# Altium schematic sheet Sheet1.SchDoc
size A2; SheetNumber: 1; SheetTotal: 1
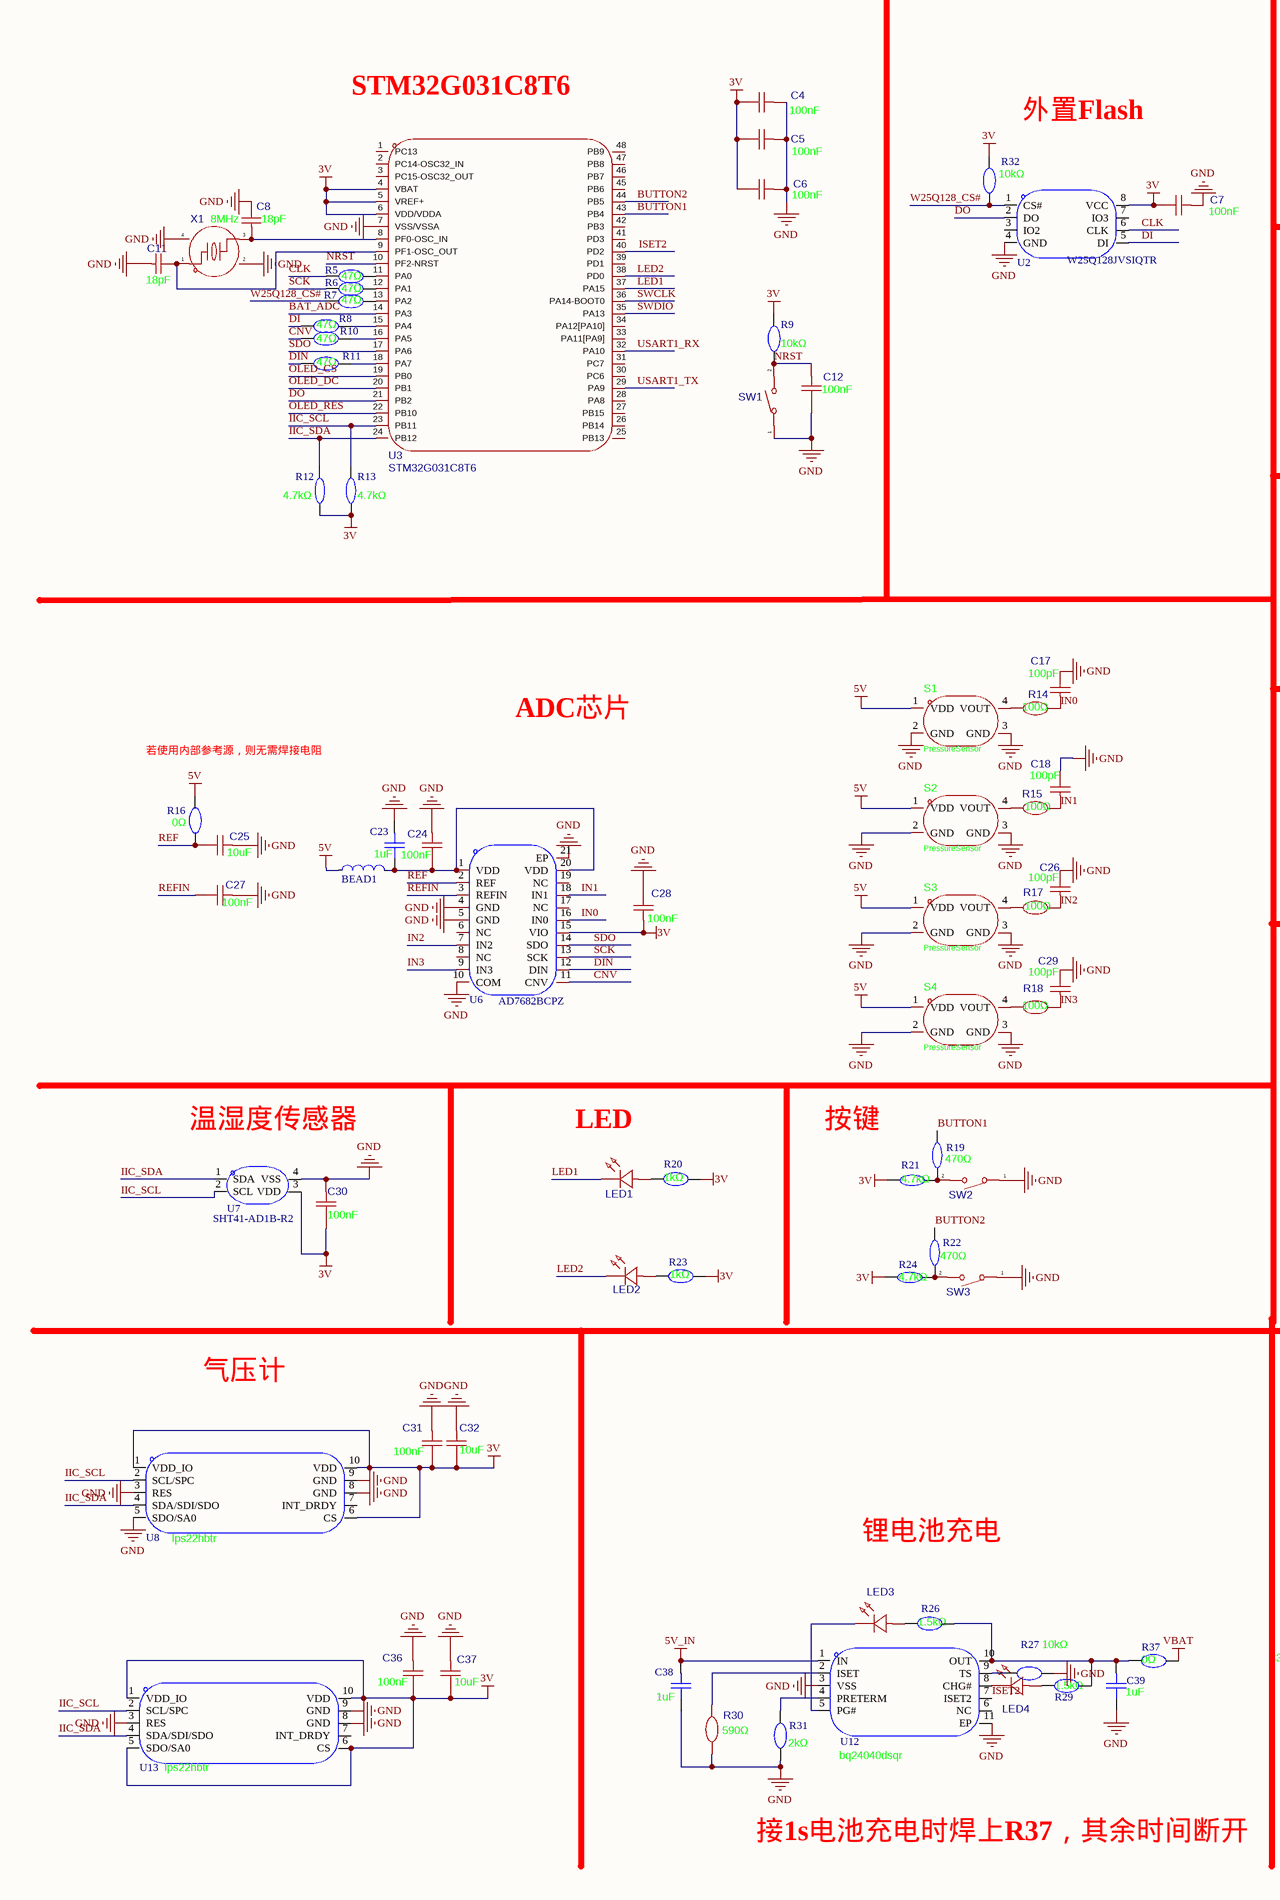
[diagram p0: Sheet1.SchDoc, left]
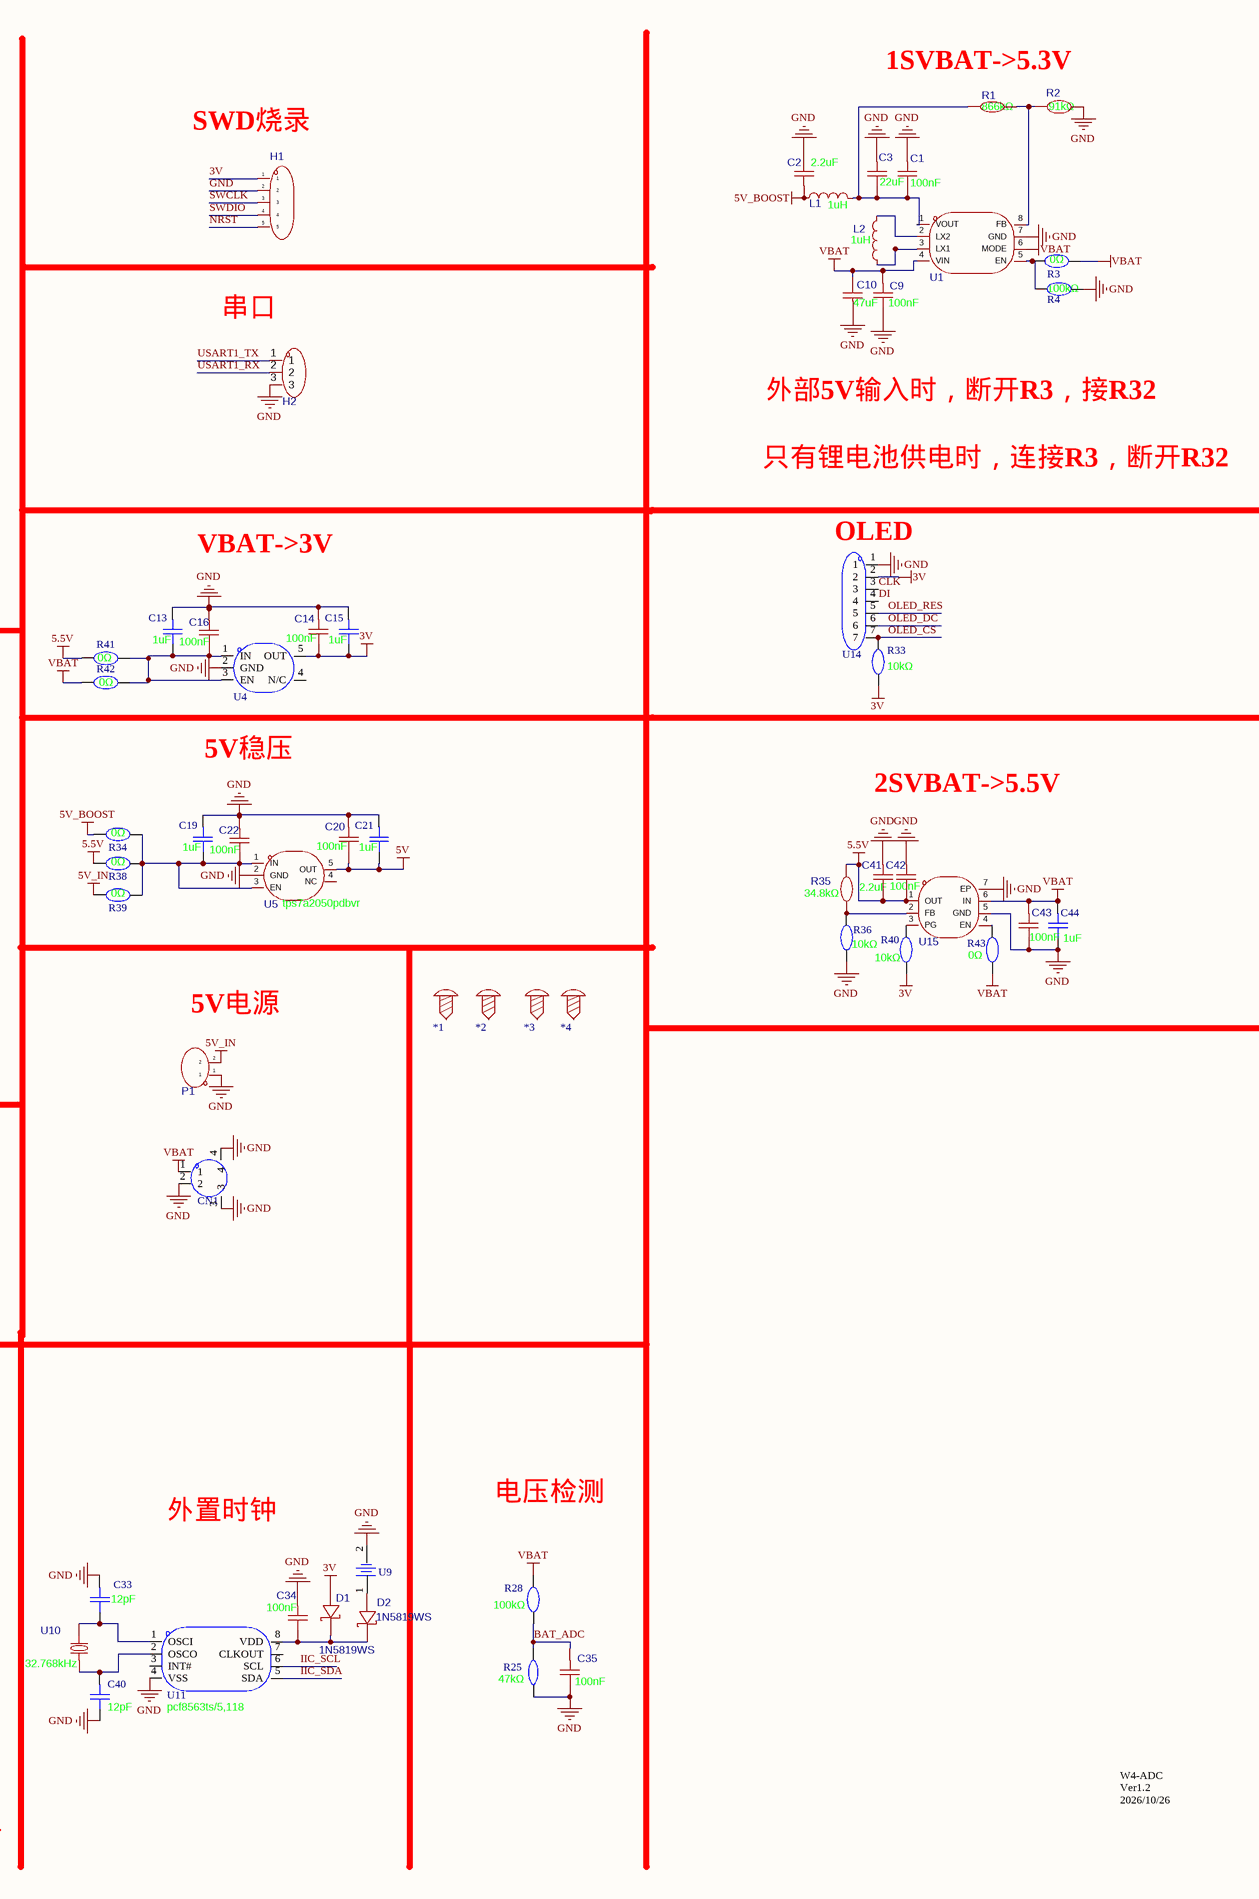
[diagram p1: Sheet1.SchDoc, right]

## Parts
*1  螺丝孔_1  [M3螺丝]  (value not drawn)
*2  螺丝孔_1  [M3螺丝]  (value not drawn)
*3  螺丝孔_1  [M3螺丝]  (value not drawn)
*4  螺丝孔_1  [M3螺丝]  (value not drawn)
BEAD1  cbm321609u000t  [L1206]  (value not drawn)
C1  value 100nF  [C0402]  (hidden comment: cc0402krx7r7bb104)
C2  value 2.2uF  [C0603]  (hidden comment: hgc0603r5225k500nthj)
C3  value 22uF  [C0805]  (hidden comment: cga0805x5r226m250mt)
C4  value 100nF  [C0402]  (hidden comment: cc0402krx7r7bb104)
C5  value 100nF  [C0402]  (hidden comment: cc0402krx7r7bb104)
C6  value 100nF  [C0402]  (hidden comment: cc0402krx7r7bb104)
C7  value 100nF  [C0402]  (hidden comment: cc0402krx7r7bb104)
C8  value 18pF  [C0402]  (hidden comment: cc0402jrnpo9bn180)
C9  value 100nF  [C0402]  (hidden comment: cc0402krx7r7bb104)
C10  value 47uF  [C0805]  (hidden comment: cl21a476mqynnne)
C11  value 18pF  [C0402]  (hidden comment: cc0402jrnpo9bn180)
C12  value 100nF  [C0402]  (hidden comment: cc0402krx7r7bb104)
C13  value 1uF  [C0402]  (hidden comment: cga0402x5r105k500gt)
C14  value 100nF  [C0402]  (hidden comment: cc0402krx7r7bb104)
C15  value 1uF  [C0402]  (hidden comment: cga0402x5r105k500gt)
C16  value 100nF  [C0402]  (hidden comment: cc0402krx7r7bb104)
C17  value 100pF  [C0402]  (hidden comment: cc0402jrnpo9bn101)
C18  value 100pF  [C0402]  (hidden comment: cc0402jrnpo9bn101)
C19  value 1uF  [C0402]  (hidden comment: cga0402x5r105k500gt)
C20  value 100nF  [C0402]  (hidden comment: cc0402krx7r7bb104)
C21  value 1uF  [C0402]  (hidden comment: cga0402x5r105k500gt)
C22  value 100nF  [C0402]  (hidden comment: cc0402krx7r7bb104)
C23  value 1uF  [C0402]  (hidden comment: cga0402x5r105k500gt)
C24  value 100nF  [C0402]  (hidden comment: cc0402krx7r7bb104)
C25  value 10uF  [C0603]  (hidden comment: hgc0603r5106m350nthj)
C26  value 100pF  [C0402]  (hidden comment: cc0402jrnpo9bn101)
C27  value 100nF  [C0402]  (hidden comment: cc0402krx7r7bb104)
C28  value 100nF  [C0402]  (hidden comment: cc0402krx7r7bb104)
C29  value 100pF  [C0402]  (hidden comment: cc0402jrnpo9bn101)
C30  value 100nF  [C0402]  (hidden comment: cc0402krx7r7bb104)
C31  value 100nF  [C0402]  (hidden comment: cc0402krx7r7bb104)
C32  value 10uF  [C0603]  (hidden comment: hgc0603r5106m350nthj)
C33  value 12pF  [C0402]  (hidden comment: cga0402c0g120j500gt)
C34  value 100nF  [C0402]  (hidden comment: cc0402krx7r7bb104)
C35  value 100nF  [C0402]  (hidden comment: cc0402krx7r7bb104)
C36  value 100nF  [C0402]  (hidden comment: cc0402krx7r7bb104)
C37  value 10uF  [C0603]  (hidden comment: hgc0603r5106m350nthj)
C38  value 1uF  [C0402]  (hidden comment: cga0402x5r105k500gt)
C39  value 1uF  [C0402]  (hidden comment: cga0402x5r105k500gt)
C40  value 12pF  [C0402]  (hidden comment: cga0402c0g120j500gt)
C41  value 2.2uF  [C0603]  (hidden comment: hgc0603r5225k500nthj)
C42  value 100nF  [C0402]  (hidden comment: cc0402krx7r7bb104)
C43  value 100nF  [C0402]  (hidden comment: cc0402krx7r7bb104)
C44  value 1uF  [C0402]  (hidden comment: cga0402x5r105k500gt)
CN1  2.54-2a-lt  [CONN-SMD_2P-P2.54_XH2.54-2AB]  (value not drawn)
D1  Symbol: 1N5819WS  [SOD-323_L1.8-W1.3-LS2.5-RD]  (hidden comment: 1n5819ws_c191023)
D2  Symbol: 1N5819WS  [SOD-323_L1.8-W1.3-LS2.5-RD]  (hidden comment: 1n5819ws_c191023)
H1  pz254v-11-05p  [HDR-TH_5P-P2.54-V-M]  (value not drawn)
H2  lail-pz2.54-3p-l  [HDR-TH_3P-P2.54-V-M-1]  (value not drawn)
L1  value 1uH  [IND-SMD_L2.0-W1.2_PCT201210]  (hidden comment: pct201210-1r0-m)
L2  value 1uH  [IND-SMD_L2.0-W1.2_PCT201210]  (hidden comment: pct201210-1r0-m)
LED1  xl-1005ugc_c965793  [LED0402-RD_GREEN]  (value not drawn)
LED2  xl-1005ugc_c965793  [LED0402-RD_GREEN]  (value not drawn)
LED3  xl-1005ugc_c965793  [LED0402-RD_GREEN]  (value not drawn)
LED4  xl-1005ugc_c965793  [LED0402-RD_GREEN]  (value not drawn)
P1  wj15edgrc-3.81-02p-14-00a  [CONN-TH_2P-P3.81_WJ15EDGRC-3.81-2P]  (value not drawn)
R1  value 866kΩ  [R0402]  (hidden comment: 0402wgf8663tce)
R2  value 91kΩ  [R0402]  (hidden comment: rt0402brd0791kl)
R3  value 0Ω  [R0402]  (hidden comment: frc0402f0000ts)
R4  value 100kΩ  [R0402]  (hidden comment: frc0402f1003ts)
R5  value 47Ω  [R0201]  (hidden comment: 0201wmf470jtee)
R6  value 47Ω  [R0201]  (hidden comment: 0201wmf470jtee)
R7  value 47Ω  [R0201]  (hidden comment: 0201wmf470jtee)
R8  value 47Ω  [R0201]  (hidden comment: 0201wmf470jtee)
R9  value 10kΩ  [R0402]  (hidden comment: frc0402f1002ts)
R10  value 47Ω  [R0201]  (hidden comment: 0201wmf470jtee)
R11  value 47Ω  [R0201]  (hidden comment: 0201wmf470jtee)
R12  value 4.7kΩ  [R0402]  (hidden comment: rc0402fr-074k7l)
R13  value 4.7kΩ  [R0402]  (hidden comment: rc0402fr-074k7l)
R14  value 100Ω  [R0402]  (hidden comment: frc0402f1000ts)
R15  value 100Ω  [R0402]  (hidden comment: frc0402f1000ts)
R16  value 0Ω  [R0402]  (hidden comment: frc0402f0000ts)
R17  value 100Ω  [R0402]  (hidden comment: frc0402f1000ts)
R18  value 100Ω  [R0402]  (hidden comment: frc0402f1000ts)
R19  value 470Ω  [R0402]  (hidden comment: 0402wgf4700tce)
R20  value 1kΩ  [R0402]  (hidden comment: frc0402j102 ts)
R21  value 4.7kΩ  [R0402]  (hidden comment: rc0402fr-074k7l)
R22  value 470Ω  [R0402]  (hidden comment: 0402wgf4700tce)
R23  value 1kΩ  [R0402]  (hidden comment: frc0402j102 ts)
R24  value 4.7kΩ  [R0402]  (hidden comment: rc0402fr-074k7l)
R25  value 47kΩ  [R0402]  (hidden comment: 0402wgf4702tce)
R26  value 1.5kΩ  [R0402]  (hidden comment: frc0402f1501ts)
R27  value 10kΩ  [R0402]  (hidden comment: frc0402f1002ts)
R28  value 100kΩ  [R0402]  (hidden comment: frc0402f1003ts)
R29  value 1.5kΩ  [R0402]  (hidden comment: frc0402f1501ts)
R30  value 590Ω  [R0402]  (hidden comment: frc0402f5900ts)
R31  value 2kΩ  [R0402]  (hidden comment: frc0402f2001ts)
R32  value 10kΩ  [R0402]  (hidden comment: frc0402f1002ts)
R33  value 10kΩ  [R0402]  (hidden comment: frc0402f1002ts)
R34  value 0Ω  [R0402]  (hidden comment: frc0402f0000ts)
R35  value 34.8kΩ  [R0402]  (hidden comment: frc0402f3482ts)
R36  value 10kΩ  [R0402]  (hidden comment: frc0402f1002ts)
R37  value 0Ω  [R0402]  (hidden comment: frc0402f0000ts)
R38  value 0Ω  [R0402]  (hidden comment: frc0402f0000ts)
R39  value 0Ω  [R0402]  (hidden comment: frc0402f0000ts)
R40  value 10kΩ  [R0402]  (hidden comment: frc0402f1002ts)
R41  value 0Ω  [R0402]  (hidden comment: frc0402f0000ts)
R42  value 0Ω  [R0402]  (hidden comment: frc0402f0000ts)
R43  value 0Ω  [R0402]  (hidden comment: frc0402f0000ts)
S1  PressureSensor  [PressureSensor]
S2  PressureSensor  [PressureSensor]
S3  PressureSensor  [PressureSensor]
S4  PressureSensor  [PressureSensor]
SW1  ts-1088-ar02016  [SW-SMD_L3.9-W3.0-P4.45]  (value not drawn)
SW2  ts-1088-ar02016  [SW-SMD_L3.9-W3.0-P4.45]  (value not drawn)
SW3  ts-1088-ar02016  [SW-SMD_L3.9-W3.0-P4.45]  (value not drawn)
U1  tps631000drlr  [SOT-583-8_L2.1-W1.2-P0.50-LS1.6-BL]  (value not drawn)
U2  Symbol: W25Q128JVSIQTR  [SOIC-8_L5.3-W5.3-P1.27-LS8.0-BL]  (hidden comment: w25q128jvsiq)
U3  stm32g031c8t6  [LQFP-48_L7.0-W7.0-P0.50-LS9.0-BL]
U4  lp5907mfx-3.0/nopb  [SOT-23-5_L3.0-W1.7-P0.95-LS2.8-BL]  (value not drawn)
U5  tps7a2050pdbvr  [SOT-23-5_L2.9-W1.6-P0.95-LS2.8-BR]
U6  ad7682bcpz  [LFCSP-20_L4.0-W4.0-P0.50-BL-EP]
U7  sht41-ad1b-r2  [DFN-4_L1.5-W1.5-SHT41-AD1B-R2]
U8  lps22hbtr  [HLGA-10L_LPS22HBTR]
U9  xdcr-1220-006  [BAT-SMD_CR1220-2ZX]  (value not drawn)
U10  value 32.768kHz  [CRYSTAL-SMD_L3.2-W1.5]  (hidden comment: fc31m2-32.768-ntlnndtl)
U11  pcf8563ts/5,118  [TSSOP-8_L3.0-W3.0-P0.65-LS4.9-BL]
U12  bq24040dsqr  [WSON-10_L2.0-W2.0-P0.40-BL-EP]
U13  lps22hbtr  [HLGA-10L_LPS22HBTR]
U14  kh-2.54fh-1x7p-h8.5  [HDR-TH_7P-P2.54-V-F]  (value not drawn)
U15  tps7a2501drvr  [WSON-6_L2.0-W2.0-P0.65-TL-EP]  (value not drawn)
X1  value 8MHz  [CRYSTAL-SMD_4P-L3.2-W2.5-BL]  (hidden comment: x32258mob4si)

## Nets
3V: C4.1 C5.1 C6.1 C7.1 C14.1 C15.1 C28.2 C30.1 C31.1 C32.1 C36.1 C37.1 D1.2(A) H1.1 R9.2 R12.1 R13.1 R20.2 R21.1 R23.2 R24.1 R32.2 R33.1 R40.1 U2.8(VCC) U3.4(VBAT) U3.5(VREF+) U3.6(VDD/VDDA) U4.5(OUT) U6.15(VIO) U7.3(VDD) U8.1(VDD_IO) U8.6(CS) U8.10(VDD) U13.1(VDD_IO) U13.5(SDO/SA0) U13.6(CS) U13.10(VDD) U14.2
5.5V: C41.1 C42.1 R35.2 R38.2 R41.1 U15.1(OUT)
5V: BEAD1.1 C20.1 C21.1 R16.2 S1.1(VDD) S2.1(VDD) S3.1(VDD) S4.1(VDD) U5.5(OUT)
5V_BOOST: C2.2 L1.1 R34.2
5V_IN: C38.2 P1.2 R39.2 U12.1(IN)
GND: C1.2 C2.1 C3.2 C4.2 C5.2 C6.2 C7.2 C8.2 C9.1 C10.1 C11.1 C12.1 C13.2 C14.2 C15.2 C16.2 C17.2 C18.2 C19.2 C20.2 C21.2 C22.2 C23.2 C24.2 C25.2 C26.2 C27.2 C28.1 C29.2 C30.2 C31.2 C32.2 C33.2 C34.2 C35.1 C36.2 C37.2 C38.1 C39.1 C40.1 C41.2 C42.2 C43.1 C44.1 CN1.2 CN1.3 CN1.4 H1.2 H2.3 P1.1 R2.2 R4.2 R25.1 R27.2 R30.1 R31.1 R36.1 S1.2(GND) S1.3(GND) S2.2(GND) S2.3(GND) S3.2(GND) S3.3(GND) S4.2(GND) S4.3(GND) SW1.1 SW2.1 SW3.1 U1.7(GND) U2.4(GND) U3.7(VSS/VSSA) U4.2(GND) U5.2(GND) U6.4(GND) U6.5(GND) U6.10(COM) U6.21(EP) U7.4(VSS) U8.3(RES) U8.5(SDO/SA0) U8.8(GND) U8.9(GND) U9.2 U11.4(VSS) U12.3(VSS) U12.11(EP) U13.3(RES) U13.8(GND) U13.9(GND) U14.1 U15.5(GND) U15.7(EP) X1.2(GND) X1.4(GND)
VBAT: C9.2 C10.2 C43.2 C44.2 CN1.1 R3.1 R28.2 R37.2 R42.1 R43.1 U1.4(VIN) U1.6(MODE) U15.6(IN)
BAT_ADC: C35.2 R25.2 R28.1 U3.14(PA3)
BUTTON1: R19.2 U3.43(PB4)
BUTTON2: R22.2 U3.44(PB5)
CLK: R5.1 U2.6(CLK) U14.3
CNV: R10.1 U6.11(CNV)
DI: R8.1 U2.5(DI) U14.4
DIN: R11.1 U6.12(DIN)
DO: U2.2(DO) U3.21(PB2)
IIC_SCL: R13.2 U3.23(PB11) U7.2(SCL) U8.2(SCL/SPC) U11.6(SCL) U13.2(SCL/SPC)
IIC_SDA: R12.2 U3.24(PB12) U7.1(SDA) U8.4(SDA/SDI/SDO) U11.5(SDA) U13.4(SDA/SDI/SDO)
IN0: C17.1 R14.2 U6.16(IN0)
IN1: C18.1 R15.2 U6.18(IN1)
IN2: C26.1 R17.2 U6.7(IN2)
IN3: C29.1 R18.2 U6.9(IN3)
ISET2: U3.40(PD2) U12.7(ISET2)
LED1: LED1.1(K) U3.37(PA15)
LED2: LED2.1(K) U3.38(PD0)
NRST: C12.2 H1.5 R9.1 SW1.2 U3.10(PF2-NRST)
OLED_CS: R33.2 U3.19(PB0) U14.7
OLED_DC: U3.20(PB1) U14.6
OLED_RES: U3.22(PB10) U14.5
REF: C25.1 R16.1 U6.2(REF)
REFIN: C27.1 U6.3(REFIN)
SCK: R6.1 U6.13(SCK)
SDO: U3.17(PA6) U6.14(SDO)
SWCLK: H1.3 U3.36(PA14-BOOT0)
SWDIO: H1.4 U3.35(PA13)
USART1_RX: H2.2 U3.32(PA10)
USART1_TX: H2.1 U3.29(PA9)
W25Q128_CS#: R7.1 R32.1 U2.1(CS#)
NetBEAD1_2: BEAD1.2 C23.1 C24.1 U6.1(VDD) U6.20(VDD)
NetC1_1: C1.1 C3.1 L1.2 R1.1 U1.1(VOUT)
NetC8_1: C8.1 U3.8(PF0-OSC_IN) X1.3
NetC11_2: C11.2 U3.9(PF1-OSC_OUT) X1.1
NetC13_1: C13.1 C16.1 R41.2 R42.2 U4.1(IN) U4.3(EN)
NetC19_1: C19.1 C22.1 R34.1 R38.1 R39.1 U5.1(IN) U5.3(EN)
NetC33_1: C33.1 U10.2 U11.1(OSCI)
NetC34_1: C34.1 D1.1(K) D2.1(K) U11.8(VDD)
NetC39_2: C39.2 R26.2 R29.2 R37.1 U12.10(OUT)
NetC40_2: C40.2 U10.1 U11.2(OSCO)
NetD2_2: D2.2(A) U9.1
NetL2_1: L2.1 U1.3(LX1)
NetL2_2: L2.2 U1.2(LX2)
NetLED1_2: LED1.2(A) R20.1
NetLED2_2: LED2.2(A) R23.1
NetLED3_1: LED3.1(K) U12.5(PG#)
NetLED3_2: LED3.2(A) R26.1
NetLED4_1: LED4.1(K) U12.8(CHG#)
NetLED4_2: LED4.2(A) R29.1
NetR1_2: R1.2 R2.1 U1.8(FB)
NetR3_2: R3.2 R4.1 U1.5(EN)
NetR5_2: R5.2 U3.11(PA0)
NetR6_2: R6.2 U3.12(PA1)
NetR7_2: R7.2 U3.13(PA2)
NetR8_2: R8.2 U3.15(PA4)
NetR10_2: R10.2 U3.16(PA5)
NetR11_2: R11.2 U3.18(PA7)
NetR14_1: R14.1 S1.4(VOUT)
NetR15_1: R15.1 S2.4(VOUT)
NetR17_1: R17.1 S3.4(VOUT)
NetR18_1: R18.1 S4.4(VOUT)
NetR19_1: R19.1 R21.2 SW2.2
NetR22_1: R22.1 R24.2 SW3.2
NetR27_1: R27.1 U12.9(TS)
NetR30_2: R30.2 U12.2(ISET)
NetR31_2: R31.2 U12.4(PRETERM)
NetR35_1: R35.1 R36.2 U15.2(FB)
NetR40_2: R40.2 U15.3(PG)
NetR43_2: R43.2 U15.4(EN)

Not connected (* = marked no-connect by the designer): *1 1; *2 1; *3 1; *4 1; U2 3(IO2) 7(IO3); U3 1(PC13) 2(PC14-OSC32_IN) 3(PC15-OSC32_OUT) 25(PB13) 26(PB14) 27(PB15) 28(PA8) 30(PC6) 31(PC7) 33(PA11[PA9]) 34(PA12[PA10]) 39(PD1) 41(PD3) 42(PB3) 45(PB6) 46(PB7) 47(PB8) 48(PB9); U4 4(N/C); U5 4(NC); U6 6(NC) 8(NC) 17(NC) 19(NC); U8 7(INT_DRDY); U11 3(INT#) 7(CLKOUT); U12 6(NC); U13 7(INT_DRDY)

## Notes on the sheet
- 1SVBAT->5.3V
- STM32G031C8T6
- 外置Flash
- (near H1) SWD烧录
- 串口
- 外部5V输入时，断开R3，接R32
- 只有锂电池供电时，连接R3，断开R32
- VBAT->3V
- (near U14) OLED
- ADC芯片
- 5V稳压
- 若使用内部参考源，则无需焊接电阻
- 2SVBAT->5.5V
- (near P1) 5V电源
- (near U7) 温湿度传感器
- LED
- 按键
- 气压计
- 锂电池充电
- 外置时钟
- 电压检测
- W4-ADC
  Ver1.2
  2026/10/26
- 接1s电池充电时焊上R37，其余时间断开

## Library data of the parts
BEAD1 = cbm321609u000t: 阻抗@频率:0Ω@100MHz;直流电阻(DCR):10mΩ;; Manufacturer: FH(风华); AddInBom: yes; ModelId: 85bdab7b3d4c4074b81d208eb5e865b3; ModelName: L1206_L3.2-W1.6-H1.1; ModelTransform: 125.984,62.835,0,0,0,0,0,0,0; DC Resistance(DCR): 10mΩ; Current Rating: 6A; Number of Circuits: 1; Symbol: CBM321609U000T; LCSC Part Name: 单路 1206磁珠 阻抗0Ω@100MHz; SupplierPart: C391206; ManufacturerPart: CBM321609U000T; Supplier Footprint: 1206; JLCPCB Part Class: Extended Part; Datasheet: https://item.szlcsc.com/datasheet/CBM321609U000T/367610.html; Supplier: LCSC; ConvertToPcb: yes; FootprintName: L1206; Impedance @ Frequency: 0Ω@100MHz; Operating Temperature: -55℃~+125℃
C1 C4-C7 C9 C12 C14 C16 C20 C22 C24 C27 C28 C30 C31 C34-C36 C42 C43 = cc0402krx7r7bb104: 容值:100nF;精度:±10%;额定电压:16V;温度系数:X7R;; Manufacturer: YAGEO(国巨); AddInBom: yes; ModelId: 36a51122f27c49738f86b3bfa98863e0; ModelName: C0402_L1.0-W0.5-H0.5; ModelTransform: 39.37,19.685,0,0,0,0,0,0,0; Tolerance: ±10%; Voltage Rating: 16V; Temperature Coefficient: X7R; Symbol: CC0402KRX7R7BB104; LCSC Part Name: 100nF ±10% 16V; SupplierPart: C60474; ManufacturerPart: CC0402KRX7R7BB104; Supplier Footprint: 0402; JLCPCB Part Class: Extended Part; Datasheet: https://item.szlcsc.com/datasheet/CC0402KRX7R7BB104/61526.html; Supplier: LCSC; ConvertToPcb: yes; FootprintName: C0402
C2 C41 = hgc0603r5225k500nthj: 容值:2.2uF;精度:±10%;额定电压:50V;温度系数:X5R;; Manufacturer: Chinocera(华瓷); AddInBom: yes; ModelId: ac125912035d415993ca9572d50418b1; ModelName: C0603_L1.6-W0.8-H0.8; ModelTransform: 62.992,31.496,0,0,0,0,0,0,0; Tolerance: ±10%; Voltage Rating: 50V; Temperature Coefficient: X5R; Symbol: HGC0603R5225K500NTHJ; LCSC Part Name: 2.2uF ±10% 50V; SupplierPart: C7432769; ManufacturerPart: HGC0603R5225K500NTHJ; Supplier Footprint: 0603; JLCPCB Part Class: Extended Part; Datasheet: https://item.szlcsc.com/datasheet/HGC0603R5225K500NTHJ/8438251.html; Supplier: LCSC; ConvertToPcb: yes; FootprintName: C0603
C3 = cga0805x5r226m250mt: 容值:22uF;精度:±20%;额定电压:25V;温度系数:X5R;; Manufacturer: HRE(芯声); AddInBom: yes; ModelId: 1ba041120af144c991958decab20d241; ModelName: C0805_L2.0-W1.3-H1.3; ModelTransform: 78.74,51.181,0,0,0,0,0,0.0005,0; Tolerance: ±20%; Voltage Rating: 25V; Temperature Coefficient: X5R; Symbol: CGA0805X5R226M250MT; LCSC Part Name: 22uF ±20% 25V; SupplierPart: C6119899; ManufacturerPart: CGA0805X5R226M250MT; Supplier Footprint: 0805; JLCPCB Part Class: Extended Part; Datasheet: https://item.szlcsc.com/datasheet/CGA0805X5R226M250MT/7062605.html; Supplier: LCSC; ConvertToPcb: yes; FootprintName: C0805
C8 C11 = cc0402jrnpo9bn180: 容值:18pF;精度:±5%;额定电压:50V;温度系数:NP0;; Manufacturer: YAGEO(国巨); AddInBom: yes; ModelId: 36a51122f27c49738f86b3bfa98863e0; ModelName: C0402_L1.0-W0.5-H0.5; ModelTransform: 39.37,19.685,0,0,0,0,0,0,0; Tolerance: ±5%; Voltage Rating: 50V; Temperature Coefficient: NP0; Symbol: CC0402JRNPO9BN180; LCSC Part Name: 18pF ±5% 50V; SupplierPart: C106202; ManufacturerPart: CC0402JRNPO9BN180; Supplier Footprint: 0402; JLCPCB Part Class: Extended Part; Datasheet: https://item.szlcsc.com/datasheet/CC0402JRNPO9BN180/107417.html; Supplier: LCSC; ConvertToPcb: yes; FootprintName: C0402
C10 = cl21a476mqynnne: 容值:47uF;精度:±20%;额定电压:6.3V;温度系数:X5R;; Manufacturer: SAMSUNG(三星); AddInBom: yes; ModelId: 1ba041120af144c991958decab20d241; ModelName: C0805_L2.0-W1.3-H1.3; ModelTransform: 78.74,51.181,0,0,0,0,0,0.0005,0; Tolerance: ±20%; Voltage Rating: 6.3V; Temperature Coefficient: X5R; Symbol: CL21A476MQYNNNE; LCSC Part Name: 47uF ±20% 6.3V; SupplierPart: C16780; ManufacturerPart: CL21A476MQYNNNE; Supplier Footprint: 0805; JLCPCB Part Class: Basic Part; Datasheet: https://item.szlcsc.com/datasheet/CL21A476MQYNNNE/17464.html; Supplier: LCSC; ConvertToPcb: yes; FootprintName: C0805
C13 C15 C19 C21 C23 C38 C39 C44 = cga0402x5r105k500gt: 容值:1uF;精度:±10%;额定电压:50V;温度系数:X5R;; Manufacturer: HRE(芯声); AddInBom: yes; ModelId: 36a51122f27c49738f86b3bfa98863e0; ModelName: C0402_L1.0-W0.5-H0.5; ModelTransform: 39.37,19.685,0,0,0,0,0,0,0; Tolerance: ±10%; Voltage Rating: 50V; Temperature Coefficient: X5R; Symbol: CGA0402X5R105K500GT; LCSC Part Name: 1uF ±10% 50V; SupplierPart: C6119811; ManufacturerPart: CGA0402X5R105K500GT; Supplier Footprint: 0402; JLCPCB Part Class: Extended Part; Datasheet: https://item.szlcsc.com/datasheet/CGA0402X5R105K500GT/7062517.html; Supplier: LCSC; ConvertToPcb: yes; FootprintName: C0402
C17 C18 C26 C29 = cc0402jrnpo9bn101: 容值:100pF;精度:±5%;额定电压:50V;温度系数:NP0;; Manufacturer: YAGEO(国巨); AddInBom: yes; ModelId: 36a51122f27c49738f86b3bfa98863e0; ModelName: C0402_L1.0-W0.5-H0.5; ModelTransform: 39.37,19.685,0,0,0,0,0,0,0; Tolerance: ±5%; Voltage Rating: 50V; Temperature Coefficient: NP0; Symbol: CC0402JRNPO9BN101; LCSC Part Name: 100pF ±5% 50V; SupplierPart: C106200; ManufacturerPart: CC0402JRNPO9BN101; Supplier Footprint: 0402; JLCPCB Part Class: Extended Part; Datasheet: https://item.szlcsc.com/datasheet/CC0402JRNPO9BN101/107415.html; Supplier: LCSC; ConvertToPcb: yes; FootprintName: C0402
C25 C32 C37 = hgc0603r5106m350nthj: 容值:10uF;精度:±20%;额定电压:35V;温度系数:X5R;; Manufacturer: Chinocera(华瓷); AddInBom: yes; ModelId: ac125912035d415993ca9572d50418b1; ModelName: C0603_L1.6-W0.8-H0.8; ModelTransform: 62.992,31.496,0,0,0,0,0,0,0; Tolerance: ±20%; Voltage Rating: 35V; Temperature Coefficient: X5R; Symbol: HGC0603R5106M350NTHJ; LCSC Part Name: 10uF ±20% 35V; SupplierPart: C22367827; ManufacturerPart: HGC0603R5106M350NTHJ; Supplier Footprint: 0603; JLCPCB Part Class: Extended Part; Datasheet: https://item.szlcsc.com/datasheet/HGC0603R5106M350NTHJ/23841132.html; Supplier: LCSC; ConvertToPcb: yes; FootprintName: C0603
C33 C40 = cga0402c0g120j500gt: 容值:12pF;精度:±5%;额定电压:50V;温度系数:C0G;; Manufacturer: HRE(芯声); AddInBom: yes; ModelId: 36a51122f27c49738f86b3bfa98863e0; ModelName: C0402_L1.0-W0.5-H0.5; ModelTransform: 39.37,19.685,0,0,0,0,0,0,0; Tolerance: ±5%; Voltage Rating: 50V; Temperature Coefficient: C0G; Symbol: CGA0402C0G120J500GT; LCSC Part Name: 12pF ±5% 50V 停产; SupplierPart: C45359894; ManufacturerPart: CGA0402C0G120J500GT; Supplier Footprint: 0402; JLCPCB Part Class: Extended Part; Datasheet: https://item.szlcsc.com/datasheet/CGA0402C0G120J500GT/47452244.html; Supplier: LCSC; ConvertToPcb: yes; FootprintName: C0402
CN1 = 2.54-2a-lt: 插针结构:1x2P;间距:2.54mm;安装方式:立贴;参考系列:XH;总PIN数:2P;排数:1;每排PIN数:2;行距:-;额定电流:500mA;触头材质:磷铜;触头镀层:锡;工作温度:-25℃~+85℃;; Manufacturer: CAX(创都); AddInBom: yes; ModelId: d8a33bf5c0154e0995c08ba39c3c8f35; ModelName: CONN-SMD_XH2.54-LS-2P; ModelTransform: 393.7,354.33,0,0,0,0,0,9.843,0; Pins Structure: 1x2P; Pitch: 2.54mm; Reference Series: XH; Number of PINs Per Row: 2; Current Rating: 500mA; Voltage Rating: 50V; Plastic Material: LCP; Z-Height of the Board: 7.9mm; Y-Width of Bottom Edge on Board: 6mm; Symbol: 2.54-2A-LT; LCSC Part Name: 1x2P 间距:2.54mm 立贴 系列:XH; SupplierPart: C722695; ManufacturerPart: 2.54-2A-LT; Supplier Footprint: SMD,P=2.54mm; JLCPCB Part Class: Extended Part; Datasheet: https://item.szlcsc.com/datasheet/2.54-2A-LT/766902.html; Supplier: LCSC; ConvertToPcb: yes; FootprintName: CONN-SMD_2P-P2.54_XH2.54-2AB; Mounting Type: 立贴; Number of Pins: 2P; Number of Rows: 1; Row Spacing: -; Contact Material: 磷铜; Contact Plating: 锡; Operating Temperature: -25℃~+85℃; Color: 米色
D1 D2 = 1n5819ws_c191023: 正向压降(Vf):600mV@1A;直流反向耐压(Vr):40V;整流电流:1A;; Manufacturer: Hottech(合科泰); AddInBom: yes; ModelId: db63db13d9e342eb939127d413d6200b; ModelTransform: 104.3305,51.181,0,0,0,0,0,-0.004,0; Voltage - DC Reverse(Vr): 40V; Current - Rectified: 1A; Non-Repetitive Peak Forward Surge Current: 25A; LCSC Part Name: 电压:40V 电流:1A; SupplierPart: C191023; ManufacturerPart: 1N5819WS; Supplier Footprint: SOD-323; JLCPCB Part Class: Basic Part; Datasheet: https://item.szlcsc.com/datasheet/1N5819WS/213850.html; Supplier: LCSC; ConvertToPcb: yes; FootprintName: SOD-323_L1.8-W1.3-LS2.5-RD; ModelName: SOD-323_L1.8-W1.3-LS2.5-RD; Voltage - Forward(Vf@If): 600mV@1A
H1 = pz254v-11-05p: 插针结构:1x5P;间距:2.54mm;行距:-;圆针/方针:方针;安装方式:直插;排数:单排;总PIN位数:5P;额定电流:3A;额定电压:250V;配合针长度:6mm;塑高:2.5mm;端接针长度:3mm;触头材质:黄铜;触头镀层:-;工作温度:-40℃~+105℃;颜色:黑色;; Manufacturer: XFCN(兴飞); AddInBom: yes; ModelId: 47d466e4a34f4fc5bc626cf773a24dd5; ModelName: HDR-TH_5P-P2.54-M-LI-1X5P; ModelTransform: 499.999,100,0,0,0,0,0,0,-118.11; Pin Structure: 1x5P; Pitch: 2.54mm; Circluar Pins/Square Pins: 方针; Current Rating: 3A; Voltage Rating (Max): 250V; Symbol: PZ254V-11-05P; LCSC Part Name: 1x5P 间距:2.54mm 方针 直插; SupplierPart: C492404; ManufacturerPart: PZ254V-11-05P; Supplier Footprint: 插件,P=2.54mm; JLCPCB Part Class: Extended Part; Datasheet: https://item.szlcsc.com/datasheet/PZ254V-11-05P/502960.html; Supplier: LCSC; ConvertToPcb: yes; FootprintName: HDR-TH_5P-P2.54-V-M; Row Spacing: -; Mounting Type: 直插; Number of Rows: 单排; Number of Pins: 5P; Length of Mating Pin: 6mm; Insulation Height: 2.5mm; Length of End Connection Pin: 3mm; Contact Material: 黄铜; Contact Plating: -; Operating Temperature: -40℃~+105℃; Color: 黑色
H2 = lail-pz2.54-3p-l: 插针结构:1x3P;间距:2.54mm;圆针/方针:方针;排数:单排;总PIN位数:3P;额定电流:3A;额定电压:250V;塑高:2.5mm;端接针长度:3mm;触头材质:黄铜;触头镀层:金;工作温度:-25℃~+80℃;颜色:黑色;; Manufacturer: LAILAN(莱联); AddInBom: yes; ModelId: 94a8ffe137b6410295cb18cd3ffd99db; ModelName: HDR-M-2.54_1x3; ModelTransform: 299.9994,100,0,0,0,0,0,0,-118.11; Pin Structure: 1x3P; Pitch: 2.54mm; Circluar Pins/Square Pins: 方针; Current Rating: 3A; Voltage Rating (Max): 250V; LCSC Part Name: 1x3P 间距:2.54mm 方针; SupplierPart: C54950604; ManufacturerPart: LAIL-PZ2.54-3P-L; Supplier Footprint: 插件,P=2.54mm; JLCPCB Part Class: Extended Part; Datasheet: https://item.szlcsc.com/datasheet/LAIL-PZ2.54-3P-L/58519957.html; Supplier: LCSC; ConvertToPcb: yes; SymbolName: LAIL-PZ2.54-3P-L; FootprintName: HDR-TH_3P-P2.54-V-M-1; Number of Rows: 单排; Number of Pins: 3P; Insulation Height: 2.5mm; Length of End Connection Pin: 3mm; Contact Material: 黄铜; Contact Plating: 金; Operating Temperature: -25℃~+80℃; Color: 黑色
L1 L2 = pct201210-1r0-m: 小型化一体成型T-CORE，小体积，扁线工艺，感值小; Manufacturer: JIERR(捷而瑞); AddInBom: yes; Tolerance: ±20%; Current Rating: 3A; Current - Saturation(Isat): 3.3A; DC Resistance(DCR): 80mΩ; Type: 一体成型电感; Symbol: PCT201210-1R0-M; LCSC Part Name: 1μH ±20% 3.3A; SupplierPart: C54557069; ManufacturerPart: PCT201210-1R0-M; Supplier Footprint: 0805; JLCPCB Part Class: Extended Part; Datasheet: https://item.szlcsc.com/datasheet/PCT201210-1R0-M/57921657.html; Supplier: LCSC; ConvertToPcb: yes; FootprintName: IND-SMD_L2.0-W1.2_PCT201210
LED1-LED4 = xl-1005ugc_c965793: 灯头类型:1.0mmx0.5mm方形灯头;发光颜色:翠绿色;正向压降(Vf):3V;功率:80mW;正向电流:25mA;波长:516nm~531nm;二极管配置:独立二极管;透镜颜色:无色透明透镜;色温:-;发光强度:249mcd;发光角度:120°;载带方式:正贴;工作温度:-40℃~+85℃;; Manufacturer: XINGLIGHT(成兴光); AddInBom: yes; ModelId: 080bb9bd520f4b34ac21e218e7b036d6; ModelName: LED0402_L1.0-W0.5-H0.2; ModelTransform: 40.1574,19.685,0,0,0,0,0,-0.0005,0; Illumination Color: 翠绿色; Voltage - Forward(Vf): 3V; Power(Watts): 80mW; Forward Current: 25mA; Peak Wavelength: 531nm; Diode Configuration: 独立二极管; Lens Color: 无色透明透镜; Luminous Intensity: 249mcd; Viewing Angle: 120°; Symbol: XL-1005UGC; LCSC Part Name: 0402翠绿贴片式发光二极管; SupplierPart: C965793; ManufacturerPart: XL-1005UGC; Supplier Footprint: 0402; JLCPCB Part Class: Extended Part; Datasheet: https://item.szlcsc.com/datasheet/XL-1005UGC/1051402.html; Supplier: LCSC; ConvertToPcb: yes; FootprintName: LED0402-RD_GREEN; Lamp Holder Type: 1.0mmx0.5mm方形灯头; Wavelength - Dominant: 516nm~531nm; Color Temperature: -; Mounting Style: 正贴; Operating Temperature: -40℃~+85℃
P1 = wj15edgrc-3.81-02p-14-00a: 连接器类型:板端/插座-闭口;固定方式:无固定装置;结构:1x2P;间距:3.81mm;颜色:绿色;安装方式:弯插;排数:1;每排PIN数:2;额定电流:8A;额定电压:300V;线规 - AWG:-;线规 - 平方毫米:-;工作温度:-40℃~+105℃;; Manufacturer: KANGNEX(康奈克斯电气); Symbol: WJ15EDGRC-3.81-2P; AddInBom: yes; ModelId: 816ec8aca6fe4785be70cb4c5121258d; ModelName: CONN-TH_2P_L8.5-W9.2-H7.0-P3.81; ModelTransform: 334.645,360.2355,0,0,0,0,0,-118.11,-137.795; Number of Positions or Pins: 1x2P; Pitch: 3.81mm; Number of PINs Per Row: 2; Current Rating: 8A; Voltage Rating (Max): 300V; LCSC Part Name: 无固定装置 1x2P 3.81mm 排数:1 每排P数:2; SupplierPart: C8387; ManufacturerPart: WJ15EDGRC-3.81-02P-14-00A; Supplier Footprint: 弯插,P=3.81mm; JLCPCB Part Class: Extended Part; Datasheet: https://item.szlcsc.com/datasheet/WJ15EDGRC-3.81-02P-14-00A/8881.html; Supplier: LCSC; ConvertToPcb: yes; FootprintName: CONN-TH_2P-P3.81_WJ15EDGRC-3.81-2P; Connector Type: 板端/插座-闭口; Termination Style: 无固定装置; Color: 绿色; Mounting Type: 弯插; Number of Pins: 2P; Number of Rows: 1; Wire Gauge - AWG: -; Wire Gauge - mm2: -; Operating Temperature: -40℃~+105℃; Connection Type: -; Outlet Direction (Vertical Basis): -
R1 = 0402wgf8663tce: 电阻类型:厚膜电阻;阻值:866kΩ;精度:±1%;功率:62.5mW;工作电压:50V;温度系数:±100ppm/℃;; Manufacturer: UNI-ROYAL(厚声); AddInBom: yes; ModelId: 98c88bc2b9094f218f3a3e30a7012738; ModelName: R0402_L1.0-W0.5-H0.4; ModelTransform: 39.37,19.685,0,0,0,0,0,0,0; Tolerance: ±1%; Power(Watts): 62.5mW; Voltage-Supply(Max): 50V; Symbol: 0402WGF8663TCE; LCSC Part Name: 厚膜电阻 866kΩ ±1%; SupplierPart: C27020; ManufacturerPart: 0402WGF8663TCE; Supplier Footprint: 0402; JLCPCB Part Class: Extended Part; Datasheet: https://item.szlcsc.com/datasheet/0402WGF8663TCE/27769.html; Supplier: LCSC; ConvertToPcb: yes; FootprintName: R0402; Type: 厚膜电阻; Temperature Coefficient: ±100ppm/℃; Operating Temperature: -55℃~+155℃
R2 = rt0402brd0791kl: 电阻类型:薄膜电阻;阻值:91kΩ;精度:±0.1%;功率:62.5mW;工作电压:50V;温度系数:±25ppm/℃;; Manufacturer: YAGEO(国巨); AddInBom: yes; ModelId: 98c88bc2b9094f218f3a3e30a7012738; ModelName: R0402_L1.0-W0.5-H0.4; ModelTransform: 39.37,19.685,0,0,0,0,0,0,0; Tolerance: ±0.1%; Power(Watts): 62.5mW; Voltage-Supply(Max): 50V; Symbol: RT0402BRD0791KL; LCSC Part Name: 薄膜电阻 91kΩ ±0.1% 62.5mW; SupplierPart: C852952; ManufacturerPart: RT0402BRD0791KL; Supplier Footprint: 0402; JLCPCB Part Class: Extended Part; Datasheet: https://item.szlcsc.com/datasheet/RT0402BRD0791KL/913274.html; Supplier: LCSC; ConvertToPcb: yes; FootprintName: R0402; Type: 薄膜电阻; Temperature Coefficient: ±25ppm/℃; Operating Temperature: -55℃~+155℃
R3 R16 R34 R37-R39 R41-R43 = frc0402f0000ts: 电阻类型:厚膜电阻;阻值:0Ω;精度:±1%;功率:62.5mW;工作电压:50V;温度系数:±400ppm/℃;; Manufacturer: FOJAN(富捷); AddInBom: yes; ModelId: 98c88bc2b9094f218f3a3e30a7012738; ModelName: R0402_L1.0-W0.5-H0.4; ModelTransform: 39.37,19.685,0,0,0,0,0,0,0; Tolerance: ±1%; Power(Watts): 62.5mW; Voltage-Supply(Max): 50V; Symbol: FRC0402F0000TS; LCSC Part Name: 0Ω ±1% 62.5mW 厚膜电阻; SupplierPart: C2906858; ManufacturerPart: FRC0402F0000TS; Supplier Footprint: 0402; JLCPCB Part Class: Extended Part; Datasheet: https://item.szlcsc.com/datasheet/FRC0402F0000TS/3180371.html; Supplier: LCSC; ConvertToPcb: yes; FootprintName: R0402; Type: 厚膜电阻; Temperature Coefficient: ±400ppm/℃; Operating Temperature: -55℃~+155℃
R4 R28 = frc0402f1003ts: 电阻类型:厚膜电阻;阻值:100kΩ;精度:±1%;功率:62.5mW;工作电压:50V;温度系数:±100ppm/℃;; Manufacturer: FOJAN(富捷); AddInBom: yes; ModelId: 98c88bc2b9094f218f3a3e30a7012738; ModelName: R0402_L1.0-W0.5-H0.4; ModelTransform: 39.37,19.685,0,0,0,0,0,0,0; Tolerance: ±1%; Power(Watts): 62.5mW; Voltage-Supply(Max): 50V; Symbol: FRC0402F1003TS; LCSC Part Name: 100kΩ ±1% 62.5mW 厚膜电阻; SupplierPart: C2906859; ManufacturerPart: FRC0402F1003TS; Supplier Footprint: 0402; JLCPCB Part Class: Extended Part; Datasheet: https://item.szlcsc.com/datasheet/FRC0402F1003TS/3180372.html; Supplier: LCSC; ConvertToPcb: yes; FootprintName: R0402; Type: 厚膜电阻; Temperature Coefficient: ±100ppm/℃; Operating Temperature: -55℃~+155℃
R5-R8 R10 R11 = 0201wmf470jtee: 电阻类型:厚膜电阻;阻值:47Ω;精度:±1%;功率:50mW;最大工作电压:25V;温度系数:±200ppm/℃;; Manufacturer: UNI-ROYAL(厚声); AddInBom: yes; ModelId: 0e006ba4c37b4b73b0e85d5d1c6800cb; ModelName: R0201_L0.6-W0.3-H0.3; ModelTransform: 23.622,11.811,0,0,0,0,0,-0.0005,0; Tolerance: ±1%; Power(Watts): 50mW; Overload Voltage (Max): 25V; Symbol: 0201WMF470JTEE; LCSC Part Name: 47Ω ±1% 50mW 厚膜电阻; SupplierPart: C620443; ManufacturerPart: 0201WMF470JTEE; Supplier Footprint: 0201; JLCPCB Part Class: Extended Part; Datasheet: https://atta.szlcsc.com/upload/public/pdf/source/20200306/C422600_1E6D84923E4A46A82E41ADD87F860B5C.pdf; Supplier: LCSC; ConvertToPcb: yes; FootprintName: R0201; Type: 厚膜电阻; Temperature Coefficient: ±200ppm/℃; Operating Temperature Range: -55℃~+155℃
R9 R27 R32 R33 R36 R40 = frc0402f1002ts: 电阻类型:厚膜电阻;阻值:10kΩ;精度:±1%;功率:62.5mW;工作电压:50V;温度系数:±100ppm/℃;; Manufacturer: FOJAN(富捷); AddInBom: yes; ModelId: 98c88bc2b9094f218f3a3e30a7012738; ModelName: R0402_L1.0-W0.5-H0.4; ModelTransform: 39.37,19.685,0,0,0,0,0,0,0; Tolerance: ±1%; Power(Watts): 62.5mW; Voltage-Supply(Max): 50V; Symbol: FRC0402F1002TS; LCSC Part Name: 10kΩ ±1% 62.5mW 厚膜电阻; SupplierPart: C2906861; ManufacturerPart: FRC0402F1002TS; Supplier Footprint: 0402; JLCPCB Part Class: Extended Part; Datasheet: https://item.szlcsc.com/datasheet/FRC0402F1002TS/3180374.html; Supplier: LCSC; ConvertToPcb: yes; FootprintName: R0402; Type: 厚膜电阻; Temperature Coefficient: ±100ppm/℃; Operating Temperature: -55℃~+155℃
R12 R13 R21 R24 = rc0402fr-074k7l: 电阻类型:厚膜电阻;阻值:4.7kΩ;精度:±1%;功率:62.5mW;工作电压:50V;温度系数:±100ppm/℃;; Manufacturer: YAGEO(国巨); AddInBom: yes; ModelId: 98c88bc2b9094f218f3a3e30a7012738; ModelName: R0402_L1.0-W0.5-H0.4; ModelTransform: 39.37,19.685,0,0,0,0,0,0,0; Tolerance: ±1%; Power(Watts): 62.5mW; Voltage-Supply(Max): 50V; Symbol: RC0402FR-074K7L; LCSC Part Name: 厚膜电阻 4.7kΩ ±1% 62.5mW; SupplierPart: C105871; ManufacturerPart: RC0402FR-074K7L; Supplier Footprint: 0402; JLCPCB Part Class: Extended Part; Datasheet: https://item.szlcsc.com/datasheet/RC0402FR-074K7L/107086.html; Supplier: LCSC; ConvertToPcb: yes; FootprintName: R0402; Type: 厚膜电阻; Temperature Coefficient: ±100ppm/℃; Operating Temperature: -55℃~+155℃
R14 R15 R17 R18 = frc0402f1000ts: 电阻类型:厚膜电阻;阻值:100Ω;精度:±1%;功率:62.5mW;工作电压:50V;温度系数:±100ppm/℃;; Manufacturer: FOJAN(富捷); AddInBom: yes; ModelId: 98c88bc2b9094f218f3a3e30a7012738; ModelName: R0402_L1.0-W0.5-H0.4; ModelTransform: 39.37,19.685,0,0,0,0,0,0,0; Tolerance: ±1%; Power(Watts): 62.5mW; Voltage-Supply(Max): 50V; Symbol: FRC0402F1000TS; LCSC Part Name: 100Ω ±1% 62.5mW 厚膜电阻; SupplierPart: C2906860; ManufacturerPart: FRC0402F1000TS; Supplier Footprint: 0402; JLCPCB Part Class: Extended Part; Datasheet: https://item.szlcsc.com/datasheet/FRC0402F1000TS/3180373.html; Supplier: LCSC; ConvertToPcb: yes; FootprintName: R0402; Type: 厚膜电阻; Temperature Coefficient: ±100ppm/℃; Operating Temperature: -55℃~+155℃
R19 R22 = 0402wgf4700tce: 电阻类型:厚膜电阻;阻值:470Ω;精度:±1%;功率:62.5mW;工作电压:50V;温度系数:±100ppm/℃;; Manufacturer: UNI-ROYAL(厚声); AddInBom: yes; ModelId: 98c88bc2b9094f218f3a3e30a7012738; ModelName: R0402_L1.0-W0.5-H0.4; ModelTransform: 39.37,19.685,0,0,0,0,0,0,0; Tolerance: ±1%; Power(Watts): 62.5mW; Voltage-Supply(Max): 50V; Symbol: 0402WGF4700TCE; LCSC Part Name: 厚膜电阻 470Ω ±1%; SupplierPart: C25117; ManufacturerPart: 0402WGF4700TCE; Supplier Footprint: 0402; JLCPCB Part Class: Basic Part; Datasheet: https://item.szlcsc.com/datasheet/0402WGF4700TCE/25860.html; Supplier: LCSC; ConvertToPcb: yes; FootprintName: R0402; Type: 厚膜电阻; Temperature Coefficient: ±100ppm/℃; Operating Temperature: -55℃~+155℃
R20 R23 = frc0402j102 ts: 电阻类型:厚膜电阻;阻值:1kΩ;精度:±5%;功率:62.5mW;工作电压:50V;温度系数:±100ppm/℃;; Manufacturer: FOJAN(富捷); AddInBom: yes; ModelId: 98c88bc2b9094f218f3a3e30a7012738; ModelName: R0402_L1.0-W0.5-H0.4; ModelTransform: 39.37,19.685,0,0,0,0,0,0,0; Tolerance: ±5%; Power(Watts): 62.5mW; Voltage-Supply(Max): 50V; Symbol: FRC0402J102 TS; LCSC Part Name: 1kΩ ±5% 62.5mW 厚膜电阻; SupplierPart: C2906899; ManufacturerPart: FRC0402J102 TS; Supplier Footprint: 0402; JLCPCB Part Class: Extended Part; Datasheet: https://item.szlcsc.com/datasheet/FRC0402J102%2520TS/3180412.html; Supplier: LCSC; ConvertToPcb: yes; FootprintName: R0402; Type: 厚膜电阻; Temperature Coefficient: ±100ppm/℃; Operating Temperature: -55℃~+155℃
R25 = 0402wgf4702tce: 电阻类型:厚膜电阻;阻值:47kΩ;精度:±1%;功率:62.5mW;工作电压:50V;温度系数:±100ppm/℃;; Manufacturer: UNI-ROYAL(厚声); AddInBom: yes; ModelId: 98c88bc2b9094f218f3a3e30a7012738; ModelName: R0402_L1.0-W0.5-H0.4; ModelTransform: 39.37,19.685,0,0,0,0,0,0,0; Tolerance: ±1%; Power(Watts): 62.5mW; Voltage-Supply(Max): 50V; Symbol: 0402WGF4702TCE; LCSC Part Name: 厚膜电阻 47kΩ ±1%; SupplierPart: C25792; ManufacturerPart: 0402WGF4702TCE; Supplier Footprint: 0402; JLCPCB Part Class: Basic Part; Datasheet: https://item.szlcsc.com/datasheet/0402WGF4702TCE/26535.html; Supplier: LCSC; ConvertToPcb: yes; FootprintName: R0402; Type: 厚膜电阻; Temperature Coefficient: ±100ppm/℃; Operating Temperature: -55℃~+155℃
R26 R29 = frc0402f1501ts: 电阻类型:厚膜电阻;阻值:1.5kΩ;精度:±1%;功率:62.5mW;工作电压:50V;温度系数:±100ppm/℃;; Manufacturer: FOJAN(富捷); AddInBom: yes; ModelId: 98c88bc2b9094f218f3a3e30a7012738; ModelName: R0402_L1.0-W0.5-H0.4; ModelTransform: 39.37,19.685,0,0,0,0,0,0,0; Tolerance: ±1%; Power(Watts): 62.5mW; Voltage-Supply(Max): 50V; Symbol: FRC0402F1501TS; LCSC Part Name: 1.5kΩ ±1% 62.5mW 厚膜电阻; SupplierPart: C2933074; ManufacturerPart: FRC0402F1501TS; Supplier Footprint: 0402; JLCPCB Part Class: Extended Part; Datasheet: https://item.szlcsc.com/datasheet/FRC0402F1501TS/3279176.html; Supplier: LCSC; ConvertToPcb: yes; FootprintName: R0402; Type: 厚膜电阻; Temperature Coefficient: ±100ppm/℃; Operating Temperature: -55℃~+155℃
R30 = frc0402f5900ts: 电阻类型:厚膜电阻;阻值:590Ω;精度:±1%;功率:62.5mW;工作电压:50V;温度系数:±100ppm/℃;; Manufacturer: FOJAN(富捷); AddInBom: yes; ModelId: 98c88bc2b9094f218f3a3e30a7012738; ModelName: R0402_L1.0-W0.5-H0.4; ModelTransform: 39.37,19.685,0,0,0,0,0,0,0; Tolerance: ±1%; Power(Watts): 62.5mW; Voltage-Supply(Max): 50V; Symbol: FRC0402F5900TS; LCSC Part Name: 590Ω ±1% 62.5mW 厚膜电阻; SupplierPart: C2998181; ManufacturerPart: FRC0402F5900TS; Supplier Footprint: 0402; JLCPCB Part Class: Extended Part; Datasheet: https://item.szlcsc.com/datasheet/FRC0402F5900TS/3471539.html; Supplier: LCSC; ConvertToPcb: yes; FootprintName: R0402; Type: 厚膜电阻; Temperature Coefficient: ±100ppm/℃; Operating Temperature: -55℃~+155℃
R31 = frc0402f2001ts: 电阻类型:厚膜电阻;阻值:2kΩ;精度:±1%;功率:62.5mW;工作电压:50V;温度系数:±100ppm/℃;; Manufacturer: FOJAN(富捷); AddInBom: yes; ModelId: 98c88bc2b9094f218f3a3e30a7012738; ModelName: R0402_L1.0-W0.5-H0.4; ModelTransform: 39.37,19.685,0,0,0,0,0,0,0; Tolerance: ±1%; Power(Watts): 62.5mW; Voltage-Supply(Max): 50V; Symbol: FRC0402F2001TS; LCSC Part Name: 2kΩ ±1% 62.5mW 厚膜电阻; SupplierPart: C2909344; ManufacturerPart: FRC0402F2001TS; Supplier Footprint: 0402; JLCPCB Part Class: Extended Part; Datasheet: https://item.szlcsc.com/datasheet/FRC0402F2001TS/3186279.html; Supplier: LCSC; ConvertToPcb: yes; FootprintName: R0402; Type: 厚膜电阻; Temperature Coefficient: ±100ppm/℃; Operating Temperature: -55℃~+155℃
R35 = frc0402f3482ts: 电阻类型:厚膜电阻;阻值:34.8kΩ;精度:±1%;功率:62.5mW;工作电压:50V;温度系数:±100ppm/℃;; Manufacturer: FOJAN(富捷); AddInBom: yes; ModelId: 98c88bc2b9094f218f3a3e30a7012738; ModelName: R0402_L1.0-W0.5-H0.4; ModelTransform: 39.37,19.685,0,0,0,0,0,0,0; Tolerance: ±1%; Power(Watts): 62.5mW; Voltage-Supply(Max): 50V; Symbol: FRC0402F3482TS; LCSC Part Name: 34.8kΩ ±1% 62.5mW 厚膜电阻; SupplierPart: C2998092; ManufacturerPart: FRC0402F3482TS; Supplier Footprint: 0402; JLCPCB Part Class: Extended Part; Datasheet: https://item.szlcsc.com/datasheet/FRC0402F3482TS/3471450.html; Supplier: LCSC; ConvertToPcb: yes; FootprintName: R0402; Type: 厚膜电阻; Temperature Coefficient: ±100ppm/℃; Operating Temperature: -55℃~+155℃
S1-S4 = PressureSensor: 模拟压力传感器; Manufacturer Part: MAX40200AUK+T; Add into BOM: yes; Supplier Footprint: SOT-23-5; JLCPCB Part Class: Extended Part; Datasheet: https://atta.szlcsc.com/upload/public/pdf/source/20210603/11AAC644196C350B02B9F99D47093F30.pdf; Supplier: LCSC; Convert to PCB: yes
SW1-SW3 = ts-1088-ar02016: 电路结构:单刀单掷;按钮形状:圆形按钮;作用力:1.6N;安装方式:立贴;开关长度:3.9mm;开关宽度:3mm;开关高度:2mm;带支架:不带支架;触点电流:50mA;额定电压:12V;带灯:-;工作寿命:10万次;; Manufacturer: XUNPU(讯普); AddInBom: yes; ModelId: b26698b69f274ffabef8a26c7d0e5dd1; ModelName: SW-SMD_L3.9-W2.9-H2.0-LS4.8; ModelTransform: 188.976,114.174,0,0,0,0,0,0,0; Circuit: 单刀单掷; Actuator Style: 圆形按钮; Operating Force: 1.6N; Switch Height: 2mm; with Bracket: 不带支架; Contact Current: 50mA; Voltage Rating: 12V; Actuator/Cap Color: 黑色; Life: 10万次; Symbol: TS-1088-AR02016; LCSC Part Name: 3.9*3*2mm 立贴 轻触开关; SupplierPart: C720477; ManufacturerPart: TS-1088-AR02016; Supplier Footprint: SMD,4x3mm; JLCPCB Part Class: Basic Part; Datasheet: https://item.szlcsc.com/datasheet/TS-1088-AR02016/763484.html; Supplier: LCSC; ConvertToPcb: yes; FootprintName: SW-SMD_L3.9-W3.0-P4.45; Mounting Type: 立贴; Length: 3.9mm; Width: 3mm; With Lamp: -; IP Rating: -; Termination Style: SMD接片; Operating Temperature: -30℃~+80℃
U1 = tps631000drlr: 功能类型:升降压型;工作电压:1.6V~5.5V;输出电压:1.2V~5.3V;输出电流:2A;输出类型:可调;; Manufacturer: TI(德州仪器); AddInBom: yes; ModelId: 14eb3df1056d4df2aac7ceeb7e81e738; ModelTransform: 82.677,62.992,0,0,0,0,0,0,0; Function: 升降压型; Output Current: 2A; Frequency - Switching: 2.2MHz; Topology: 降压-升压式; Quiescent Current: 8uA; Switch tube (built-in/external): 内置; Output Type: 可调; Symbol: TPS631000DRLR; LCSC Part Name: 升降压型 2A 1.6V~5.5V; SupplierPart: C5219190; ManufacturerPart: TPS631000DRLR; Supplier Footprint: SOT-583; JLCPCB Part Class: Extended Part; Datasheet: https://www.ti.com/cn/lit/ds/symlink/tps631000.pdf; Supplier: LCSC; ConvertToPcb: yes; FootprintName: SOT-583-8_L2.1-W1.2-P0.50-LS1.6-BL; ModelName: SOT-583-8_L2.1-W1.2-P0.50-LS1.6-BL; Voltage - Supply: 1.6V~5.5V; Output Voltage: 1.2V~5.3V; Operating Temperature: -40℃~+125℃; Synchronous Rectifier: -; Number of Outputs: -; Features: 轻载高效模式；过流保护；负载断开
U2 = w25q128jvsiq: 接口类型:SPI;存储容量:128Mbit;时钟频率(fc):133MHz;; Manufacturer: Winbond(华邦); AddInBom: yes; ModelId: f83d990ad74f400caf5ac920b7771508; ModelName: SOIC-8_L5.3-W5.3-H1.9-LS7.9-P1.27; ModelTransform: 208.661,311.25654,0,0,0,0,-0.0005,0.0005,0; Interface: SPI; Clock Frequency: 133MHz; Voltage - Supply: 2.7V~3.6V; Standby Supply Current: 1uA; Program / Erase Cycles: 100000次; Page Programming Time (Tpp): 3ms; Block Erase Time(tBE): 120ms@(32KB); Data Retention - TDR (Year): 20年; LCSC Part Name: 编带 支持双路/四路SPI接口的3V、128Mbit 串行闪存; SupplierPart: C97521; ManufacturerPart: W25Q128JVSIQ; Supplier Footprint: SOIC-8-208mil; JLCPCB Part Class: Basic Part; Datasheet: https://item.szlcsc.com/datasheet/W25Q128JVSIQ/98729.html; Supplier: LCSC; ConvertToPcb: yes; FootprintName: SOIC-8_L5.3-W5.3-P1.27-LS8.0-BL; Memory Size: 128Mbit; Write Cycle Time (tWC): -; Operating Temperature: -40℃~+85℃; Features: 硬件写保护；绝对写保护；写使能锁存；软件写保护；上电复位
U3 = stm32g031c8t6: CPU内核:ARM Cortex-M0+;CPU最大主频:64MHz;CPU位数:32 Bit;; Manufacturer: ST(意法半导体); AddInBom: yes; ModelId: 093be70396ff421eb2cdb946d5311efc; ModelName: LQFP-48_L7.0-W7.0-H1.4-LS9.0-P0.50; ModelTransform: 354.331,354.331,0,0,0,0,0,0,0; CPU Maximum Speed: 64MHz; Core Size: 32 Bit; Program Storage Size: 64KB; Program Memory Type: FLASH; RAM Size: 8KB; Number of I/O: 44; ADC (Bit): 12bit; Oscillator Type: 内置+外置; Voltage - Supply: 1.7V~3.6V; Symbol: STM32G031C8T6; LCSC Part Name: 主流Arm Cortex-M0+ MCU，具有64 KB Flash存储器、8 KB RAM、64 MHz CPU、2x USART、定时器、ADC和通信接口，1.7-3.6V; SupplierPart: C432205; ManufacturerPart: STM32G031C8T6; Supplier Footprint: LQFP-48(7x7); JLCPCB Part Class: Extended Part; Datasheet: https://item.szlcsc.com/datasheet/STM32G031C8T6/428993.html; Supplier: LCSC; ConvertToPcb: yes; FootprintName: LQFP-48_L7.0-W7.0-P0.50-LS9.0-BL; CPU Core: ARM Cortex-M0+; EEPROM: -; Operating Temperature: -40℃~+85℃
U4 = lp5907mfx-3.0/nopb: 输出极性:正极;工作电压:5.5V;输出电压:3V;输出电流:250mA;电源纹波抑制比(PSRR):82dB@(1kHz);输出类型:固定;; Manufacturer: TI(德州仪器); AddInBom: yes; ModelId: 0a2a1b8f50944f73965918ad6e5fe167; ModelName: SOT-23-5_L2.9-W1.6-H1.1-LS2.8-P0.95; ModelTransform: 118.60433,114.173,0,90,0,0,0.0005,0.0005,0; Output Configuration: 正极; Voltage - Supply: 5.5V; Output Voltage: 3V; Output Current: 250mA; Voltage Dropout: 120mV@(250mA); standby current: 12uA; Noise: 6.5uVrms; Output Type: 固定; Number of Outputs: 1; Symbol: LP5907MFX-3.0/NOPB; LCSC Part Name: 3V 250mA 5.5V; SupplierPart: C475492; ManufacturerPart: LP5907MFX-3.0/NOPB; Supplier Footprint: SOT-23-5; JLCPCB Part Class: Extended Part; Datasheet: https://www.ti.com/cn/lit/ds/symlink/lp5907.pdf; Supplier: LCSC; ConvertToPcb: yes; FootprintName: SOT-23-5_L3.0-W1.7-P0.95-LS2.8-BL; Power Supply Rejection Ratio (PSRR): 82dB@(1kHz); Features: 热关断；使能控制；输出放电；短路保护; Operating Temperature: -40℃~+125℃@(Tj)
U5 = tps7a2050pdbvr: 输出极性:正极;工作电压:6V;输出电压:5V;输出电流:300mA;电源纹波抑制比(PSRR):65dB@(100Hz);输出类型:固定;; Manufacturer: TI(德州仪器); AddInBom: yes; ModelId: 7ba65df16e7b4570af156e925f9c37fe; ModelTransform: 114.173,114.173,0,90,0,0,0,0,0; Output Configuration: 正极; Voltage - Supply: 6V; Output Voltage: 5V; Output Current: 300mA; Voltage Dropout: 140mV@(300mA); standby current: 6.5uA; Noise: 10uVrms; Output Type: 固定; Number of Outputs: 1; Symbol: TPS7A2050PDBVR; LCSC Part Name: 800mV~5.5V 300mA 6V; SupplierPart: C2864504; ManufacturerPart: TPS7A2050PDBVR; Supplier Footprint: SOT-23-5; JLCPCB Part Class: Extended Part; Datasheet: https://www.ti.com/cn/lit/ds/symlink/tps7a20.pdf; Supplier: LCSC; ConvertToPcb: yes; FootprintName: SOT-23-5_L2.9-W1.6-P0.95-LS2.8-BR; ModelName: SOT-23-5_L2.9-W1.6-P0.95-LS2.8-BR; Power Supply Rejection Ratio (PSRR): 65dB@(100Hz); Features: 使能控制；输入欠压保护；内置软启动；短路保护；过流保护；输出放电；热关断; Operating Temperature: -40℃~+125℃@(Tj)
U6 = ad7682bcpz: 分辨率(位):16;采样率:250kHz;工作电压:2.3V~5.5V;接口类型:SPI;; Manufacturer: ADI(亚德诺); AddInBom: yes; ModelId: a3340110063d416e8a07a046bfa25306; ModelName: LFCSP-20_L4.0-W4.0-H1.0-P0.50; ModelTransform: 157.48,157.48,0,90,0,0,-0.003,0.003,0; Resolution (Bits): 16; Sampling Rate: 250kHz; number of channels: 4; Interface: SPI; differential input: 是; Integral non - linearity: 0.4LSB; Signal-to-Noise Ratio: 92.5dB; Clock/Oscillator: 内置; ADC architecture: SAR; Quiescent Current (Iq): 50nA; DNL (LSB): 0.25LSB; Symbol: AD7682BCPZ; LCSC Part Name: 16 位 4 通道 250 kSPS PulSAR ADC; SupplierPart: C398823; ManufacturerPart: AD7682BCPZ; Supplier Footprint: LFCSP-20(4x4); JLCPCB Part Class: Extended Part; Datasheet: https://item.szlcsc.com/datasheet/AD7682BCPZ/381170.html; Supplier: LCSC; ConvertToPcb: yes; FootprintName: LFCSP-20_L4.0-W4.0-P0.50-BL-EP; Voltage - Supply: 2.3V~5.5V; Operating Temperature: -40℃~+85℃; Clock Frequency: -; Voltage Reference: 内置; Programmable Gain: -; Features: 多路复用器；双极性输入；内置温度传感器
U7 = sht41-ad1b-r2: 温度范围:-40℃~+125℃;湿度范围:0%RH~100%RH;接口类型:I2C;湿度精度:±1.8%RH;; Manufacturer: Sensirion(瑞士盛思锐); AddInBom: yes; ModelId: d740bd0688d14669b1c87f9602af067d; ModelTransform: 59.13374,59.055,0,0,0,0,0,0,0; Interface: I2C; Voltage - Supply: 1.08V~3.6V; Current - Supply: 400nA; Humidity Tolerance: ±1.8%RH; Temperature Tolerance: ±0.2℃; Resolution: 16bit; Symbol: SHT41-AD1B-R2; LCSC Part Name: 3.000.466 3.000.466 ±1.8%（典型）/ 最大 ±2.5% RH 的数字式温湿度传感器; SupplierPart: C7461861; ManufacturerPart: SHT41-AD1B-R2; Supplier Footprint: DFN-4(1.5x1.5); JLCPCB Part Class: Extended Part; Datasheet: https://item.szlcsc.com/datasheet/SHT41-AD1B-R2/8492053.html; Supplier: LCSC; ConvertToPcb: yes; FootprintName: DFN-4_L1.5-W1.5-SHT41-AD1B-R2; ModelName: DFN-4_L1.5-W1.5-SHT41-AD1B-R2; Temperature Range: -40℃~+125℃; Humidity: 0%RH~100%RH; Features: 内置加热器；工厂校准
U8 U13 = lps22hbtr: 压力范围:26Kpa~1.26bar;接口类型:SPI；I2C;; Manufacturer: ST(意法半导体); AddInBom: yes; ModelId: d5ee430d14324ccb82effb2dc42ae2a1; ModelName: HLGA-10L_L2.0-W2.0-H0.8-P0.5-LPS22HBTR; ModelTransform: 78.74,78.74,0,0,0,0,0,0.195,0; Voltage - Supply: 1.7V~3.6V; Standby Current: 1uA; Module: 否; Absolute Accuracy: 0.1hpa; Symbol: LPS22HBTR; LCSC Part Name: MEMS纳米压力传感器:260 - 1260 hPa绝对数字输出气压计; SupplierPart: C94049; ManufacturerPart: LPS22HBTR; Supplier Footprint: HLGA-10(2x2); JLCPCB Part Class: Extended Part; Datasheet: https://item.szlcsc.com/datasheet/LPS22HBTR/95247.html; Supplier: LCSC; ConvertToPcb: yes; FootprintName: HLGA-10L_LPS22HBTR; Pressure range: 26Kpa~1.26bar; Interface: SPI；I2C; Relative Accuracy: 0.1hpa; Features: 片内温度补偿；集成ADC与数字接口；片内温度输出；片内校准与非易失存储；集成信号放大器; Temperature Coefficient of Offset(TCO): -; Response time: -; Operating Temperature: -40℃~+85℃
U9 = xdcr-1220-006: 连接器类型:电池底座;适用电池规格:CR1220;触头材质:-;触头镀层:金;工作温度:-40℃~+85℃;; Manufacturer: LX(连欣科技); AddInBom: yes; ModelId: aa69efc108b9406287881e5b236f6e7a; ModelName: BAT-SMD_CR1220-2; ModelTransform: 777.81069,586.46209,0,180,0,0,-19.685,0,-31.496; Connector Type: 电池底座; Battery Type: CR1220; Symbol: XDCR-1220-006; LCSC Part Name: 电池座CR1220贴片式镀金 电池底座配套电池型号：CR1220-3V; SupplierPart: C7498147; ManufacturerPart: XDCR-1220-006; Supplier Footprint: SMD; JLCPCB Part Class: Extended Part; Datasheet: https://item.szlcsc.com/datasheet/XDCR-1220-006/8568589.html; Supplier: LCSC; ConvertToPcb: yes; FootprintName: BAT-SMD_CR1220-2ZX; Contact Material: -; Contact Plating: 金; Operating Temperature: -40℃~+85℃
U10 = fc31m2-32.768-ntlnndtl: 晶振类型:贴片晶振;频率:32.768kHz;常温频差:±10ppm;负载电容:12.5pF;频率稳定度:±10ppm;; Manufacturer: HCI(杭晶); AddInBom: yes; ModelId: 762d7afc596f4558a373612390f4386d; ModelName: CRYSTAL-SMD_L3.2-W1.5-1; ModelTransform: 125.984,59.055,0,0,0,0,0,0,0; Normal temperature Frequency Tolerance: ±10ppm; Load Capacitance: 12.5pF; Equivalent Series Resistance(ESR): 70kΩ; Symbol: FC31M2-32.768-NTLNNDTL; LCSC Part Name: 3215 2P 32.768kHz 12.5pF ±10ppm -40~+85℃(±10ppm); SupplierPart: C5120559; ManufacturerPart: FC31M2-32.768-NTLNNDTL; Supplier Footprint: SMD3215-2P; JLCPCB Part Class: Extended Part; Datasheet: https://item.szlcsc.com/datasheet/FC31M2-32.768-NTLNNDTL/5705379.html; Supplier: LCSC; ConvertToPcb: yes; FootprintName: CRYSTAL-SMD_L3.2-W1.5; Type: 贴片晶振; Frequency Stability: ±10ppm; Operating Temperature: -40℃~+85℃
U11 = pcf8563ts/5,118: 接口类型:I2C;晶振类型:外置;闹钟输出:有;; Manufacturer: NXP(恩智浦); AddInBom: yes; ModelId: 6d0b9b814610470cb34a1acf75d8754c; ModelName: TSSOP-8_L3.0-W3.0-H1.1-LS4.9-P0.65; ModelTransform: 118.11,192.913,0,0,0,0,0,-0.0005,0; Interface: I2C; crystal oscillator: 外置; Alarm Output: 有; Current - Supply: 250nA; Voltage - Supply: 1.8V~5.5V; Quiescent Current(Iq): 0.25uA; Symbol: PCF8563TS/5,118; LCSC Part Name: 实时时钟/日历; SupplierPart: C27397; ManufacturerPart: PCF8563TS/5,118; Supplier Footprint: TSSOP-8-3mm; JLCPCB Part Class: Extended Part; Datasheet: https://www.nxp.com.cn/docs/zh/data-sheet/PCF8563.pdf; Supplier: LCSC; ConvertToPcb: yes; FootprintName: TSSOP-8_L3.0-W3.0-P0.65-LS4.9-BL; Operating Temperature: -40℃~+85℃; Features: 看门狗定时器；倒数计时器；告警功能；可编程时钟输出
U12 = bq24040dsqr: 工作电压:3.5V~28V;最大充电电流:1A;电池类型:锂电池;电池节数:1;; Manufacturer: TI(德州仪器); AddInBom: yes; ModelId: 0e1275d2e7d54e69a402a354e9203fe9; ModelName: WSON-10_L2.0-W2.0-H0.8-P0.40; ModelTransform: 78.74,79.527,0,0,0,0,0,0,0; The Chip Type: 充电芯片; Charge Current - Max: 1A; Charging Saturation Voltage: 4.2V; End-Off Voltage: 800mV; Type of Battery: 锂电池; Number of Cells: 1; Battery Temperature Detection: 支持; Supply Current (Iq): 1mA; Symbol: BQ24040DSQR; LCSC Part Name: 1A单输入单节锂离子和锂聚合物电池充电器; SupplierPart: C81080; ManufacturerPart: BQ24040DSQR; Supplier Footprint: WSON-10-EP(2x2); JLCPCB Part Class: Extended Part; Datasheet: https://www.ti.com/cn/lit/ds/symlink/bq24040.pdf; Supplier: LCSC; ConvertToPcb: yes; FootprintName: WSON-10_L2.0-W2.0-P0.40-BL-EP; Voltage - Supply: 3.5V~28V; Operating Temperature: 0℃~+125℃; 0V Battery Charge: 支持; Balance Current: -; Interface: -; Features: 过流保护；恒压充电；恒流充电；自动再充电；充电终止；可编程充电电流；过压保护；欠压锁定；涓流充电；短路保护
U14 = kh-2.54fh-1x7p-h8.5: 插孔结构:1x7P;间距:2.54mm;行距:-;圆孔/方孔:方孔;安装方式:直插;排数:单排;总孔位数:7P;额定电流:3A;额定电压:-;插孔方向:顶部;塑高:8.5mm;工作温度:-40℃~+105℃;; Manufacturer: kinghelm(金航标); AddInBom: yes; ModelId: 4c31987253bc43b9b52c17be2a6d3f91; ModelName: HDR-TH_7P-P2.54-F-LI-1X7P; ModelTransform: 715.7466,94.488,0,0,0,0,0,0,-118.11; Holes Structure: 1x7P; Pitch: 2.54mm; Circular Hole / Square Hole: 方孔; Number of Positions: 7P; Current Rating: 3A; Holes Direction: 顶部; Symbol: KH-2.54FH-1X7P-H8.5; LCSC Part Name: 间距:2.54mm 1x7P 直插; SupplierPart: C2932672; ManufacturerPart: KH-2.54FH-1X7P-H8.5; Supplier Footprint: 插件,P=2.54mm; JLCPCB Part Class: Extended Part; Datasheet: https://item.szlcsc.com/datasheet/KH-2.54FH-1X7P-H8.5/3278193.html; Supplier: LCSC; ConvertToPcb: yes; FootprintName: HDR-TH_7P-P2.54-V-F; Row Spacing: -; Mounting Type: 直插; Number of Rows: 单排; Voltage Rating (Max): -; Insulation Height: 8.5mm; Operating Temperature: -40℃~+105℃
U15 = tps7a2501drvr: 输出极性:正极;工作电压:18V;输出电压:1.24V~17.66V;输出电流:300mA;电源纹波抑制比(PSRR):75dB@(10Hz);输出类型:可调;; Manufacturer: TI(德州仪器); AddInBom: yes; ModelId: 521c6d8f59ad4736925338f4a59f8ef4; ModelName: WSON-6_L2.0-W2.0-H0.8-P0.65; ModelTransform: 79.527,78.74,0,0,0,0,0,0,0; Output Configuration: 正极; Voltage - Supply: 18V; Output Current: 300mA; Voltage Dropout: 340mV@(300mA); standby current: 2uA; Noise: 300uVrms; Output Type: 可调; Number of Outputs: 1; Symbol: TPS7A2501DRVR; LCSC Part Name: 1.24V~17.66V 300mA 18V; SupplierPart: C2864326; ManufacturerPart: TPS7A2501DRVR; Supplier Footprint: WSON-6-EP(2x2); JLCPCB Part Class: Extended Part; Datasheet: https://www.ti.com/cn/lit/ds/symlink/tps7a25.pdf; Supplier: LCSC; ConvertToPcb: yes; FootprintName: WSON-6_L2.0-W2.0-P0.65-TL-EP; Output Voltage: 1.24V~17.66V; Power Supply Rejection Ratio (PSRR): 75dB@(10Hz); Features: 使能控制；内置软启动；工作状态指示；过流保护；热关断；输入欠压保护; Operating Temperature: -40℃~+125℃@(Tj)
X1 = x32258mob4si: 晶振类型:贴片晶振;频率:8MHz;常温频差:±10ppm;负载电容:12pF;频率稳定度:±20ppm;; Manufacturer: YXC(扬兴晶振); AddInBom: yes; ModelId: ff2dfd5650294453a14147960efe1838; ModelTransform: 125.984,98.425,0,0,0,0,0,0,0; Normal temperature Frequency Tolerance: ±10ppm; Load Capacitance: 12pF; Frequency Stability: ±20ppm; Equivalent Series Resistance(ESR): 180Ω; Symbol: X32258MOB4SI; LCSC Part Name: YSX321SL 8MHZ 4P 3225 12PF ±10PPM -40~85℃ (±20PPM); SupplierPart: C2682775; ManufacturerPart: X32258MOB4SI; Supplier Footprint: SMD3225-4P; JLCPCB Part Class: Extended Part; Datasheet: https://item.szlcsc.com/datasheet/X32258MOB4SI/2777872.html; Supplier: LCSC; ConvertToPcb: yes; FootprintName: CRYSTAL-SMD_4P-L3.2-W2.5-BL; ModelName: CRYSTAL-SMD_4P-L3.2-W2.5-BL; Type: 贴片晶振; Operating Temperature: -40℃~+85℃